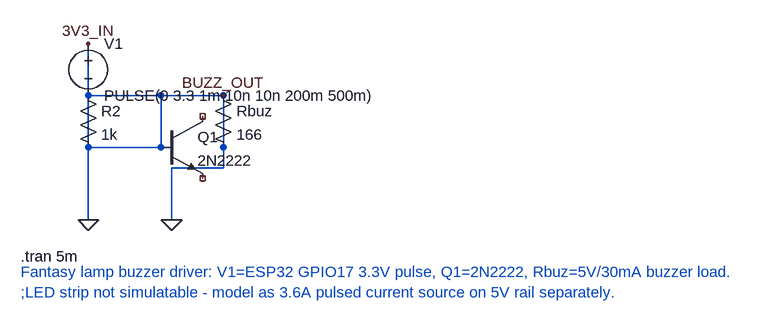
[diagram p0: schematic ltspice_lamp_driver.asc]
ltspice_lamp_driver.asc, the LTspice schematic file:
Version 4
SHEET 1 880 680
WIRE 208 208 208 128
WIRE 208 288 208 208
WIRE 320 208 208 208
WIRE 208 320 208 288
WIRE 320 288 320 208
WIRE 320 288 208 288
WIRE 416 208 320 208
WIRE 416 320 416 208
WIRE 416 320 336 320
WIRE 208 400 208 320
WIRE 336 400 336 320
FLAG 208 128 3V3_IN
FLAG 208 400 0
FLAG 336 400 0
FLAG 416 208 BUZZ_OUT
SYMBOL voltage 208 112 R0
WINDOW 123 0 0 Left 0
WINDOW 39 0 0 Left 0
SYMATTR InstName V1
SYMATTR Value PULSE(0 3.3 1m 10n 10n 200m 500m)
SYMBOL res 192 192 R0
SYMATTR InstName R2
SYMATTR Value 1k
SYMBOL npn 320 240 R0
SYMATTR InstName Q1
SYMATTR Value 2N2222
SYMBOL res 400 192 R0
SYMATTR InstName Rbuz
SYMATTR Value 166
SYMATTR Prefix X
TEXT 104 456 Left 2 !.tran 5m
TEXT 104 480 Left 2 ;Fantasy lamp buzzer driver: V1=ESP32 GPIO17 3.3V pulse, Q1=2N2222, Rbuz=5V/30mA buzzer load.\n;LED strip not simulatable - model as 3.6A pulsed current source on 5V rail separately.

The netlist it stands for:
* ltspice_lamp_driver.asc
V1 0 0 PULSE(0 3.3 1m 10n 10n 200m 500m)
R2 0 0 1k
Q1 NC_01 0 NC_02 0 2N2222
XRbuz 0 0 166  ; pins A B
.model NPN NPN
.model PNP PNP
.lib standard.bjt
.tran 5m
* Fantasy lamp buzzer driver: V1=ESP32 GPIO17 3.3V pulse, Q1=2N2222, Rbuz=5V/30mA buzzer load.
* ;LED strip not simulatable - model as 3.6A pulsed current source on 5V rail separately.
.backanno
.end